# EasyEDA Pro project jackt-tong-yong-xiao-che-kong-zhi-qi-zhuan-li-948f377a.epro, schematic IMU
Board Name: 3.v5.1_IMU小板; Create Date: 2024-12-20; Page Name: P1; Project Name: 通用小车控制器sGCARC; Schematic Name: v5.1_IMU; Update Date: 2024-12-20; Company: 深圳嘉立创科技发展有限公司; Drawed: 嘉立创EDA; Page Size: A3; Part Number: JLCPCB-001; Reviewed: 嘉立创EDA; Version: V0.1
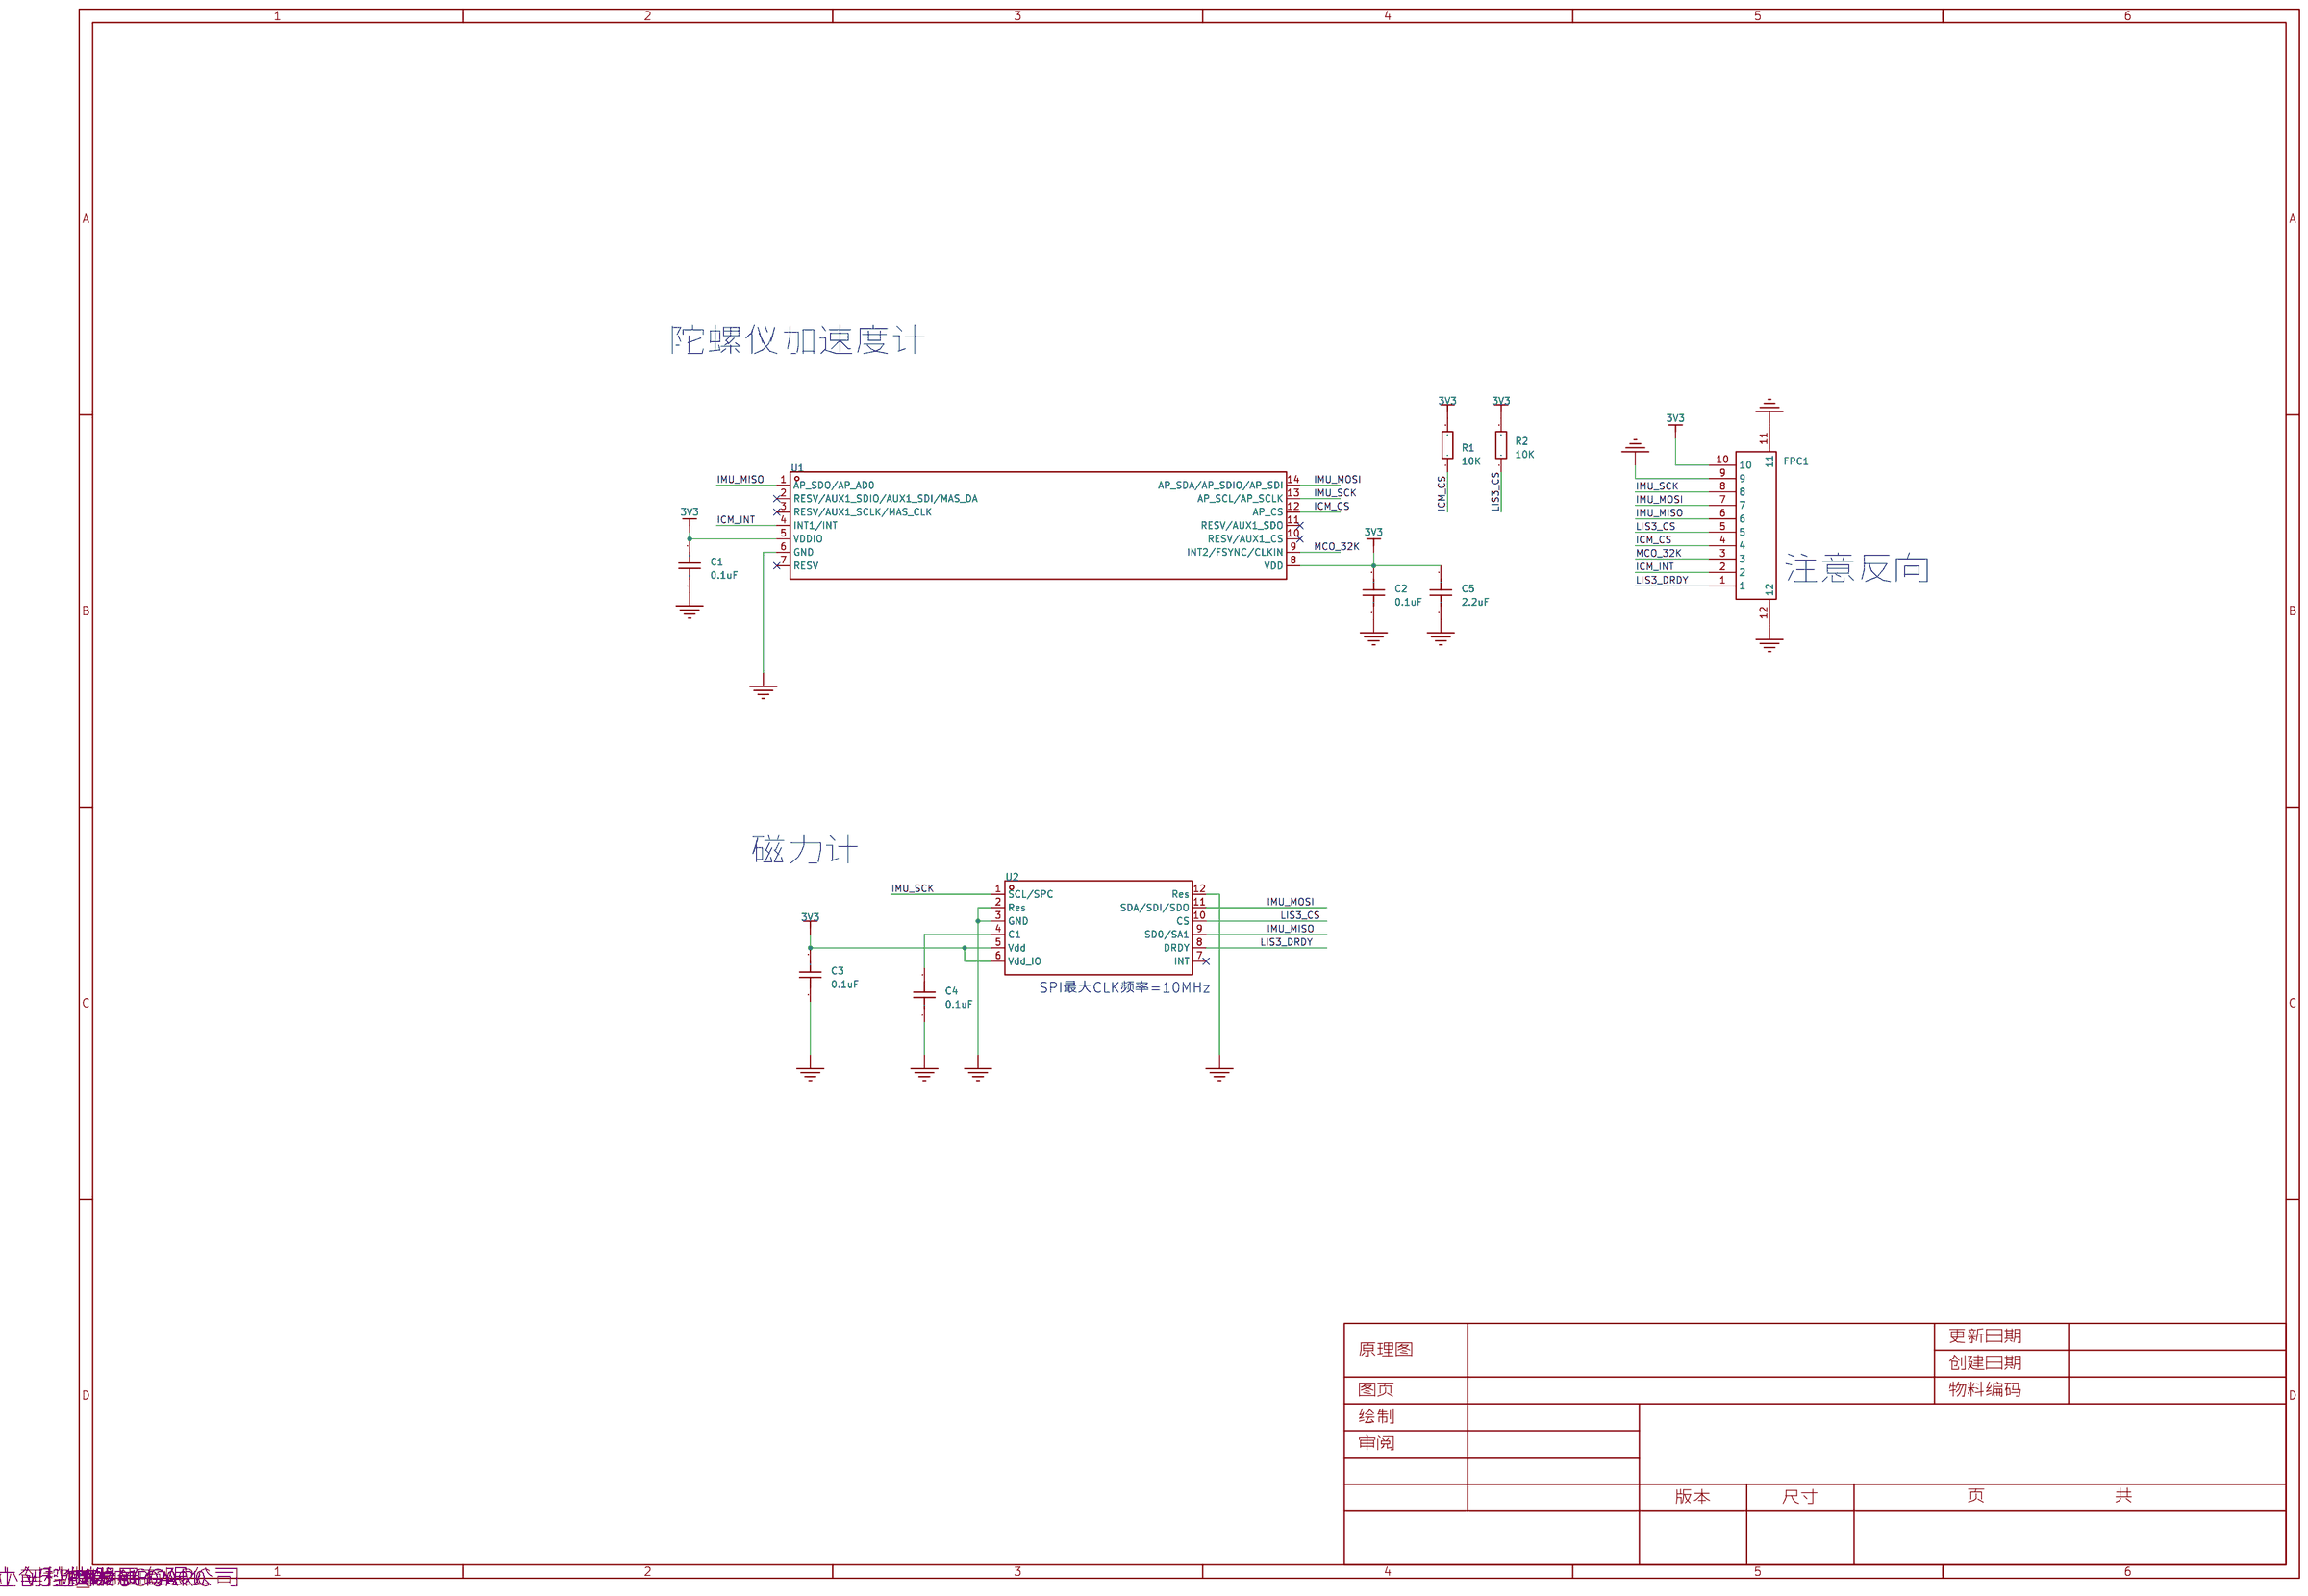
[diagram p0: schematic sheet]

## Parts
C1  0.1uF  [C0603]
C2  0.1uF  [C0603]
C3  0.1uF  [C0603]
C4  0.1uF  [C0603]
C5  2.2uF  [C0603]
FPC1  AFC01-S10FCA-00  [FPC-SMD_P0.5-10P_FGS-XJ-H2.0]
R1  10K  [R0603]
R2  10K  [R0603]
U1  ICM-45686  [LGA-14_L3.0-W2.5-P0.50-TL]
U2  LIS3MDLTR  [LGA-12_L2.0-W2.0-P0.50-BL]

## Library data of the parts
C1-C5 = CAP_0603: Supplier Footprint: 0603
FPC1 = AFC01-S10FCA-00: 锁定特性:翻盖式;触点类型:下接;触点数量:10P;间距:0.5mm;安装类型:卧贴;; LCSC Part Name: 间距:0.5mm P数:10P 翻盖式 下接; Supplier Part: C262659; Manufacturer: JS(钜硕电子); Supplier Footprint: SMD,P=0.5mm,卧贴; JLCPCB Part Class: 扩展库; Datasheet: https://atta.szlcsc.com/upload/public/pdf/source/20190816/C413942_2A72D1AC756EAE17EEDF756A339D4500.pdf; Supplier: LCSC; Locking Feature: 翻盖式; Contact Type: 下接; Number of Contacts: 10P; Pitch: 0.5mm; Mounting Type: 卧贴; FFC, FCB Thickness: 0.3mm; Height Above Board: 2mm
R1 R2 = Res_0603: Supplier Footprint: 0603
U1 = ICM-45686: Supplier Part: C22459454; Manufacturer: TDK InvenSense(应美盛); Supplier Footprint: LGA-14(3x2.5); JLCPCB Part Class: 扩展库; Datasheet: https://atta.szlcsc.com/upload/public/pdf/source/20240704/ABAB537AD22E53DEE8E4ED28732AF5C9.pdf; Supplier: LCSC
U2 = LIS3MDLTR: 3轴MEMS磁场传感器，数字输出，I2C/SPI，低功耗模式，高性能; LCSC Part Name: 三轴数字磁传感器; Supplier Part: C478483; Manufacturer: ST(意法半导体); Supplier Footprint: LGA-12(2x2); JLCPCB Part Class: 扩展库; Datasheet: https://atta.szlcsc.com/upload/public/pdf/source/20191231/C478483_325C07DDDEF2D93C2E541FB70AD6AC5C.pdf; Supplier: LCSC

## Nets
3V3: C1.2 C2.2 C3.2 C5.2 FPC1.10 R1.2 R2.2 U1.5(VDDIO) U1.8(VDD) U2.5(Vdd) U2.6(Vdd_IO)
GND: C1.1 C2.1 C3.1 C4.1 C5.1 FPC1.9 FPC1.11 FPC1.12 U1.6(GND) U2.2(Res) U2.3(GND) U2.12(Res)
ICM_CS: FPC1.4 R1.1 U1.12(AP_CS)
ICM_INT: FPC1.2 U1.4(INT1/INT)
IMU_MISO: FPC1.6 U1.1(AP_SDO/AP_AD0) U2.9(SD0/SA1)
IMU_MOSI: FPC1.7 U1.14(AP_SDA/AP_SDIO/AP_SDI) U2.11(SDA/SDI/SDO)
IMU_SCK: FPC1.8 U1.13(AP_SCL/AP_SCLK) U2.1(SCL/SPC)
LIS3_CS: FPC1.5 R2.1 U2.10(CS)
LIS3_DRDY: FPC1.1 U2.8(DRDY)
MCO_32K: FPC1.3 U1.9(INT2/FSYNC/CLKIN)
$1N533: C4.2 U2.4(C1)

Not connected (* = marked no-connect by the designer): U1 2(RESV/AUX1_SDIO/AUX1_SDI/MAS_DA)* 3(RESV/AUX1_SCLK/MAS_CLK)* 7(RESV)* 10(RESV/AUX1_CS)* 11(RESV/AUX1_SDO)*; U2 7(INT)*

## Notes on the sheet
- 陀螺仪加速度计
- 注意反向
- 磁力计
- SPI最大CLK频率=10MHz
